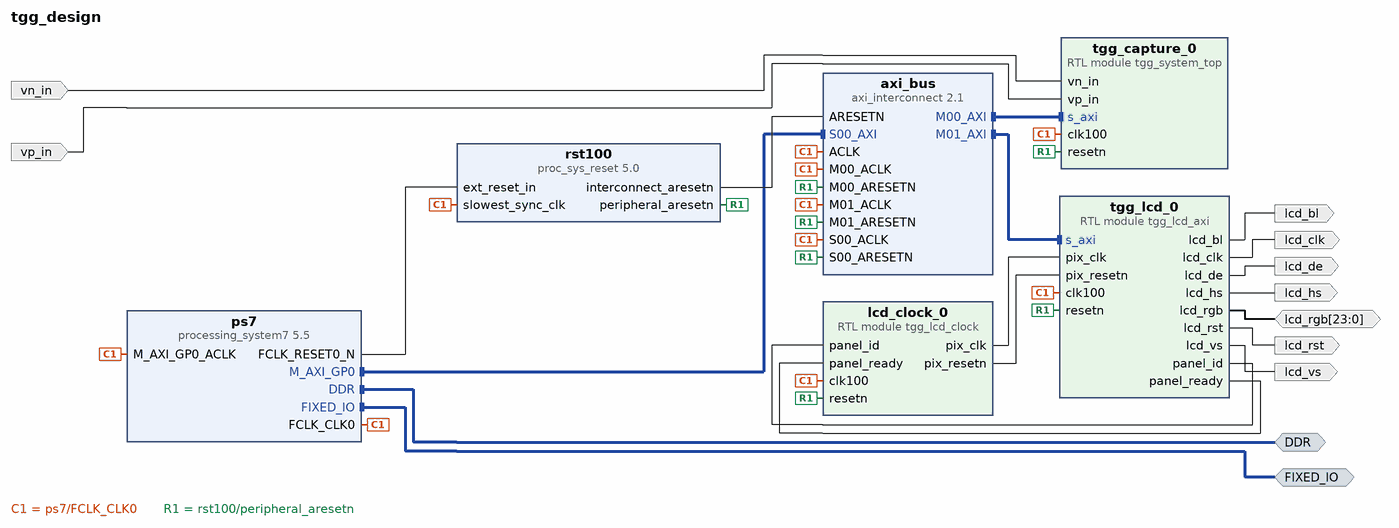
[diagram p0: block diagram of the top level]
# Vivado block design tgg_design, xc7z020clg400-2, Vivado 2025.2
create_bd_design tgg_design

create_bd_intf_port -mode Master -vlnv xilinx.com:display_processing_system7:fixedio_rtl:1.0 FIXED_IO
create_bd_intf_port -mode Master -vlnv xilinx.com:interface:ddrx_rtl:1.0 DDR
create_bd_port -dir I vp_in
create_bd_port -dir I vn_in
create_bd_port -dir O lcd_hs
create_bd_port -dir O lcd_vs
create_bd_port -dir O lcd_de
create_bd_port -dir O lcd_bl
create_bd_port -dir O -type rst lcd_rst
create_bd_port -dir O -type clk lcd_clk
create_bd_port -dir IO -from 23 -to 0 lcd_rgb

create_bd_cell -type ip -vlnv xilinx.com:ip:processing_system7:5.5 ps7
set_property -dict [list \
  CONFIG.PCW_APU_PERIPHERAL_FREQMHZ 666.666666 \
  CONFIG.PCW_FPGA0_PERIPHERAL_FREQMHZ 100.000000 \
  CONFIG.PCW_PRESET_BANK1_VOLTAGE {LVCMOS 1.8V} \
  CONFIG.PCW_UART0_PERIPHERAL_ENABLE 1 \
  CONFIG.PCW_UART0_UART0_IO {MIO 14 .. 15} \
  CONFIG.PCW_UART1_PERIPHERAL_ENABLE 0 \
  CONFIG.PCW_UART_PERIPHERAL_FREQMHZ 100 \
  CONFIG.PCW_UIPARAM_DDR_FREQ_MHZ 533.333333 \
  CONFIG.PCW_UIPARAM_DDR_MEMORY_TYPE {DDR 3 (Low Voltage)} \
  CONFIG.PCW_UIPARAM_DDR_PARTNO {MT41K256M16 RE-125} \
] [get_bd_cells ps7]
# 68 more settings of ps7 are not shown: defaults, MIO pin electricals, DDR timing, and values the tool derives
create_bd_cell -type ip -vlnv xilinx.com:ip:proc_sys_reset:5.0 rst100
create_bd_cell -type ip -vlnv xilinx.com:ip:axi_interconnect:2.1 axi_bus
set_property -dict {CONFIG.NUM_MI 2} [get_bd_cells axi_bus]
create_bd_cell -type module -reference tgg_system_top tgg_capture_0
create_bd_cell -type module -reference tgg_lcd_axi tgg_lcd_0
create_bd_cell -type module -reference tgg_lcd_clock lcd_clock_0

# ---- connections ----

connect_bd_intf_net [get_bd_intf_pins axi_bus/M00_AXI] [get_bd_intf_pins tgg_capture_0/s_axi]
connect_bd_intf_net [get_bd_intf_pins axi_bus/M01_AXI] [get_bd_intf_pins tgg_lcd_0/s_axi]
connect_bd_intf_net [get_bd_intf_ports DDR] [get_bd_intf_pins ps7/DDR]
connect_bd_intf_net [get_bd_intf_ports FIXED_IO] [get_bd_intf_pins ps7/FIXED_IO]
connect_bd_intf_net [get_bd_intf_pins ps7/M_AXI_GP0] [get_bd_intf_pins axi_bus/S00_AXI]
connect_bd_net [get_bd_ports lcd_rgb] [get_bd_pins tgg_lcd_0/lcd_rgb]
connect_bd_net [get_bd_pins lcd_clock_0/pix_clk] [get_bd_pins tgg_lcd_0/pix_clk]
connect_bd_net [get_bd_pins lcd_clock_0/pix_resetn] [get_bd_pins tgg_lcd_0/pix_resetn]
connect_bd_net [get_bd_pins ps7/FCLK_CLK0] \
  [get_bd_pins ps7/M_AXI_GP0_ACLK] [get_bd_pins rst100/slowest_sync_clk] [get_bd_pins axi_bus/ACLK] \
  [get_bd_pins axi_bus/S00_ACLK] [get_bd_pins axi_bus/M00_ACLK] [get_bd_pins axi_bus/M01_ACLK] \
  [get_bd_pins tgg_capture_0/clk100] [get_bd_pins tgg_lcd_0/clk100] [get_bd_pins lcd_clock_0/clk100]
connect_bd_net [get_bd_pins ps7/FCLK_RESET0_N] [get_bd_pins rst100/ext_reset_in]
connect_bd_net [get_bd_pins rst100/interconnect_aresetn] [get_bd_pins axi_bus/ARESETN]
connect_bd_net [get_bd_pins rst100/peripheral_aresetn] \
  [get_bd_pins axi_bus/S00_ARESETN] [get_bd_pins axi_bus/M00_ARESETN] [get_bd_pins axi_bus/M01_ARESETN] \
  [get_bd_pins tgg_capture_0/resetn] [get_bd_pins tgg_lcd_0/resetn] [get_bd_pins lcd_clock_0/resetn]
connect_bd_net [get_bd_pins tgg_lcd_0/lcd_bl] [get_bd_ports lcd_bl]
connect_bd_net [get_bd_pins tgg_lcd_0/lcd_clk] [get_bd_ports lcd_clk]
connect_bd_net [get_bd_pins tgg_lcd_0/lcd_de] [get_bd_ports lcd_de]
connect_bd_net [get_bd_pins tgg_lcd_0/lcd_hs] [get_bd_ports lcd_hs]
connect_bd_net [get_bd_pins tgg_lcd_0/lcd_rst] [get_bd_ports lcd_rst]
connect_bd_net [get_bd_pins tgg_lcd_0/lcd_vs] [get_bd_ports lcd_vs]
connect_bd_net [get_bd_pins tgg_lcd_0/panel_id] [get_bd_pins lcd_clock_0/panel_id]
connect_bd_net [get_bd_pins tgg_lcd_0/panel_ready] [get_bd_pins lcd_clock_0/panel_ready]
connect_bd_net -net vn_in_0_1 [get_bd_ports vn_in] [get_bd_pins tgg_capture_0/vn_in]
connect_bd_net -net vp_in_0_1 [get_bd_ports vp_in] [get_bd_pins tgg_capture_0/vp_in]

# ---- address map ----
assign_bd_address -offset 0x43C00000 -range 64K -target_address_space [get_bd_addr_spaces ps7/Data] [get_bd_addr_segs tgg_capture_0/s_axi/reg0]
assign_bd_address -offset 0x43C10000 -range 64K -target_address_space [get_bd_addr_spaces ps7/Data] [get_bd_addr_segs tgg_lcd_0/s_axi/reg0]

validate_bd_design
save_bd_design
